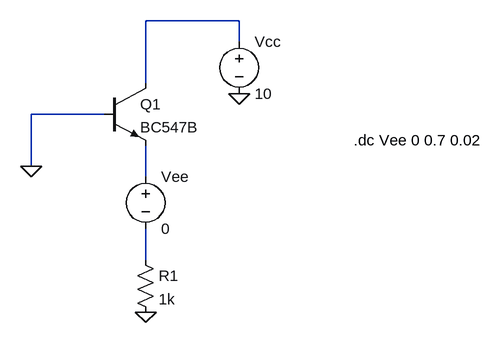
[diagram p0: schematic commonbaseinput.asc]
commonbaseinput.asc, the LTspice schematic file:
Version 4.1
SHEET 1 880 680
WIRE 288 -80 144 -80
WIRE 288 -48 288 -80
WIRE 144 16 144 -80
WIRE 80 64 -32 64
WIRE -32 144 -32 64
WIRE 144 160 144 112
WIRE 144 288 144 240
FLAG -32 144 0
FLAG 288 32 0
FLAG 144 368 0
SYMBOL npn 80 16 R0
SYMATTR InstName Q1
SYMATTR Value BC547B
SYMBOL voltage 288 -64 R0
SYMATTR InstName Vcc
SYMATTR Value 10
SYMBOL voltage 144 144 R0
SYMATTR InstName Vee
SYMATTR Value 0
SYMBOL res 128 272 R0
SYMATTR InstName R1
SYMATTR Value 1k
TEXT 464 104 Left 2 !.dc Vee 0 0.7 0.02

The netlist it stands for:
* commonbaseinput.asc
Q1 N001 0 N002 0 BC547B
Vcc N001 0 10
Vee N002 N003 0
R1 N003 0 1k
.model NPN NPN
.model PNP PNP
.lib standard.bjt
.dc Vee 0 0.7 0.02
.backanno
.end